# Altium schematic sheet AT-kdPDB.SchDoc
size A4; SheetNumber: 1; SheetTotal: 1
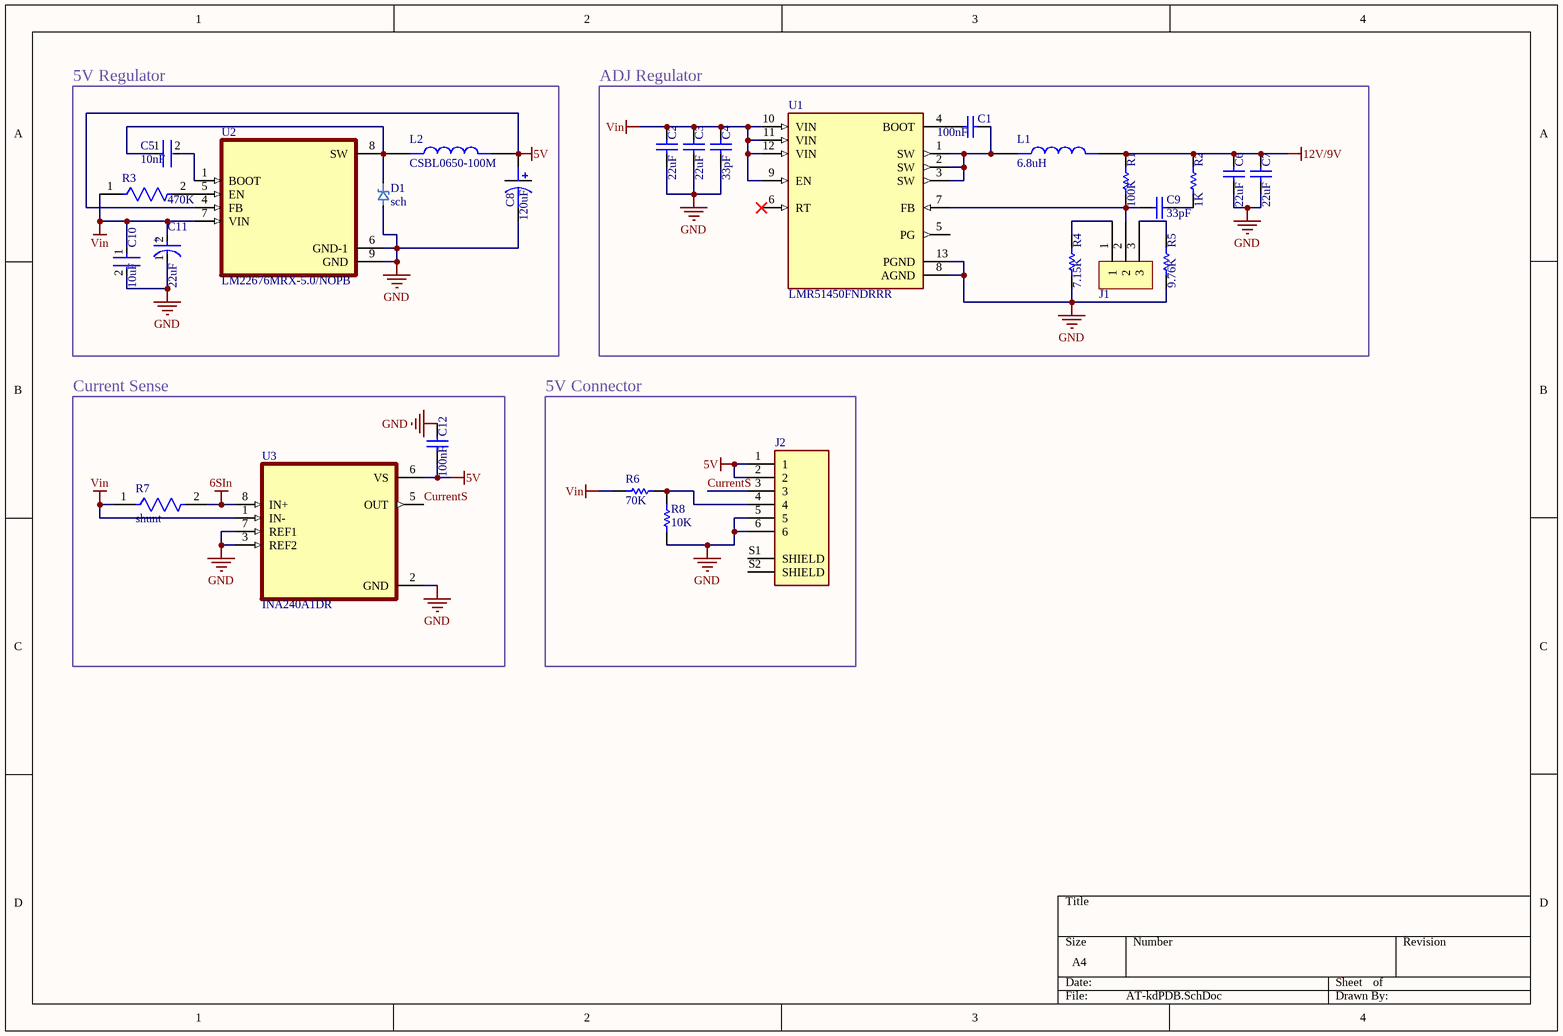
[diagram p0: AT-kdPDB.SchDoc]

## Parts
C1  100nF  [CAPC1206(3216)170_N]
C2  22uF  [CAPC1206(3216)190_L]
C3  22uF  [CAPC1206(3216)190_L]
C4  33pF  [CAPC1206(3216)190_L]
C5  10nF  [FP-C1206C-EB-MFG]
C6  22uF  [CAPC1206(3216)190_L]
C7  22uF  [CAPC1206(3216)190_L]
C8  120uF  [CAPAE660X600N]
C9  33pF  [CAPC1206(3216)170_N]
C10  10uF  [FP-GRM21B-0_2-e0_2_0_7-IPC_B]
C11  22uF  [FP-EEH-D-MFG]
C12  100nF  [CAPC1206(3216)170_N]
D1  sch  [RBR5LAM40ATFTR]
J1  jumperPad  [jumperPad]  (value not drawn)
J2  BM06B-GHS-TBT(LF)(SN)(N)  [JST_BM06B-GHS-TBT(LF)(SN)(N)]  (value not drawn)
L1  6.8uH  [IND_CSBX0650-6R8M]
L2  CSBL0650-100M  [IND_CSBL0650-100M]
R1  100K  [RESC3216X70X40ML20T20]
R2  1K  [RESC3216X70X40ML20T20]
R3  470K  [FP-CRCW1206-e3-IPC_A]
R4  7.15K  [RESC3216X70X40ML20T20]
R5  9.76K  [RESC3216X70X40ML20T20]
R6  70K  [RESC3216X70X40ML20T20]
R7  shunt  [FP-CSS2H-3920R-1L00F-MFG]
R8  10K  [RESC3216X70X40ML20T20]
U1  LMR51450FNDRRR  [CONV_LMR51450FNDRRR]
U2  LM22676MRX-5.0/NOPB  [VREG_LM5017MR/NOPB]
U3  INA240A1DR  [SOIC127P599X175-8N]

## Blocks framed on the sheet
5V Regulator: C5 C8 C10 C11 D1 L2 R3 U2
ADJ Regulator: C1-C4 C6 C7 C9 J1 L1 R1 R2 R4 R5 U1
Current Sense: C12 R7 U3
5V Connector: J2 R6 R8

## Nets
5V: C8.1(+) C12.2 J2.1 J2.2 L2.2 U2.4(FB) U3.6(VS)
6SIn: R7.2 U3.8(IN+)
12V/9V: C6.2 C7.2 L1.2 R1.2 R2.2
GND: C2.1 C3.1 C4.1 C6.1 C7.1 C8.2(-) C10.2 C11.1(C) C12.1 D1.1 J2.5 J2.6 R4.1 R5.1 R8.2 U1.8(AGND) U1.13(PGND) U2.6(GND-1) U2.9(GND) U3.2(GND) U3.3(REF2) U3.7(REF1)
Vin: C2.2 C3.2 C4.2 C10.1 C11.2(A) R3.1 R6.2 R7.1 U1.9(EN) U1.10(VIN) U1.11(VIN) U1.12(VIN) U2.7(VIN) U3.1(IN-)
CurrentS: J2.3 U3.5(OUT)
NetC1_1: C1.1 L1.1 U1.1(SW) U1.2(SW) U1.3(SW)
NetC1_2: C1.2 U1.4(BOOT)
NetC5_1: C5.1 D1.2 L2.1 U2.8(SW)
NetC5_2: C5.2 U2.1(BOOT)
NetC9_1: C9.1 J1.2 R1.1 U1.7(FB)
NetC9_2: C9.2 R2.1
NetJ1_1: J1.1 R4.2
NetJ1_3: J1.3 R5.2
NetJ2_4: J2.4 R6.1 R8.1
NetR3_2: R3.2 U2.5(EN)

Not connected (* = marked no-connect by the designer): J2 S1(SHIELD) S2(SHIELD); U1 5(PG) 6(RT)*

## Notes on the sheet
- (in symbol CMP-05428-001309-1) +

## Library data of the parts
C1 C9 C12 = CMP-1037-01161-1: CAP 33pF 500V ±2% 1206 (3216 Metric) Thickness 1.7mm SMD; Tolerance: Â±2%; Case-Metric: 3216; Case-EIA: 1206; Technology: SMT; Max Thickness: 1.7 mm; Rated Voltage: 500 V; Value: 33pF
C2-C4 C6 C7 = CMP-1037-04991-1: CAP 22uF 10V -20% to +80% 1206 (3216 Metric) Thickness 1.9mm SMD; Case-EIA: 1206; Case-Metric: 3216; Value: 22uF; Technology: SMT; Max Thickness: 1.9 mm; Rated Voltage: 10 V; Tolerance: -20% to +80%
C5 = CMP-03020-017471-2: C1206 10,000 pF X7R 5.00% 50 V; Manufacturer: KEMET; Manufacturer Part Number: C1206C103J5RAC7210; Material: Ceramic; Automotive Grade: Grade 0; Tolerance: 0.05; Voltage Rating: 50 V; Temperature Coefficient: 15%; Temperature Characteristic: X7R; Octopart: https://octopart.com/c1206c103j5rac7210-kemet-3788898; Lead Free: Yes; Automotive: Yes; Height: 0.88mm; Package: C1206C-EB; Temperature Range Low: -55°C; ComponentLink2Description: Datasheet; Ipc Land Pattern Name: CAPC320160X78; Temperature: -55°C to +150°C; Value: 10,000 pF; Capacitance: 10,000 pF; Temperature Range High: +150°C; Device Class L1: Passive Components; Device Class L3: Ceramic Capacitors; Category: Cap; Device Class L2: Capacitors; ComponentLink2URL: https://content.kemet.com/datasheets/KEM_C1007_X8R_ULTRA_150C_SMD.pdf; RoHS: TRUE
C8 = A768EB127M1DLAS034: A768, Aluminum, Polymer Aluminum, 120 uF, 20%, 20 VDC, -55/+125C, 125C, -55C, 125C, 2,000 Hrs, 34 mOhms, 480 uA, 6.3mm, 5.7mm, 1000; Manufacturer_Name: Yageo Group; Geometry.Height: 6mm; Mouser Part Number: *; Mouser Price/Stock: *; Manufacturer_Part_Number: A768EB127M1DLAS034; Datasheet Link: https://search.kemet.com/component-documentation/download/specsheet/A768EB127M1DLAS034
C10 = CMP-06035-021046-1: Chip Multilayer Ceramic Capacitors for General Purpose, 0805, 10uF, X6S, 22%, 10%, 35V; Case/Package: 0805; Case Code (Metric): 2012; Case Code (Imperial): 0805; Capacitance: 10uF; Voltage Rating (DC): 35V; Tolerance: 10%; Thickness: 0.057inch; Dielectric: X6S; Package Quantity: 3000; Weight: 0.000335oz; Termination: SMD/SMT; Max Operating Temperature: 105°C; Voltage Rating: 35V; Packaging: Tape and Reel; Width: 1.25mm; Mount: Surface Mount; Min Operating Temperature: -55°C; Length: 0.079inch; Height: 1.25mm; REACH SVHC: No SVHC; Lead Free: Lead Free
C11 = CMP-05428-001309-1: Aluminum Hybrid Polymer Capacitors 22uF 20% 50V Life 10000Hours AEC-Q200 RADIAL SMT; Ripple Current (AC): 1.1A; Lead Diameter: 0.65mm; Life (Hours): 5000Hour; ESR (Equivalent Series Resistance): 80mR; Leakage Current: 100uA; Technology: HYBRID; Height - Seated (Max): 0.24inch; Voltage Rating (DC): 50V; Min Operating Temperature: -55°C; Voltage Rating: 50V; Length: 5.8mm; Tolerance: 20%; Lead Pitch: 1.8mm; Voltage: 50V; Packaging: Tape and Reel; Mount: Surface Mount; REACH SVHC: No SVHC; Ripple Current: 1.1A; Case/Package: Radial; Package Quantity: 1000; Capacitance: 22uF; Series: ZA; Construction: Cylindrical; Diameter: 6.3mm; Height: 5.8mm; Max Operating Temperature: 105°C; Lead Free: Lead Free; RoHS Compliant: Yes; Termination: SMD/SMT; Material: Polymer; Radiation Hardening: No; Ratings: AEC-Q200
D1 = RBR5LAM40ATFTR
J2 = BM06B-GHS-TBT(LF)(SN)(N): Connector Header Surface Mount 6 position 0.049 (1.25mm); MF: JST Sales; SnapEDA_Link: https://www.snapeda.com/parts/BM06B-GHS-TBT(LF)(SN)(N)/JST/view-part/?ref=snap; Package: None; Value: *; MP: BM06B-GHS-TBT(LF)(SN)(N); Check_prices: https://www.snapeda.com/parts/BM06B-GHS-TBT(LF)(SN)(N)/JST/view-part/?ref=eda
L1 = CSBX0650-6R8M: Package: None; Price: None; Value: *; MP: CSBX0650-6R8M; Availability: Unavailable
R1 R2 R4-R6 R8 = CMP-2003-04519-1: Part Number: RK73B2BTTD104J; Manufacturer: KOA Speer
R3 = CMP-02407-010661-1: RES Thick Film, 470kΩ, 5%, 0.25W, 200ppm/°C, 1206; Max Power Dissipation: 250mW; Resistance: 470kR; Lead Free: Lead Free; Temperature Coefficient: 200ppm/°C; Length: 0.126inch; Height: 0.024inch; Number of Terminations: 2; Min Operating Temperature: -55°C; Width: 0.063inch; Max Operating Temperature: 155°C; Tolerance: 5%; Composition: Thick Film; Case/Package: 1206; Package Quantity: 20000; Features: Automotive AEC-Q200; Packaging: Tape and Reel
R7 = CMP-07231-006016-1: RES 0.001 OHM 1% 8W 3920; Temperature Coefficient: 50ppm/°C; Resistance: 1mR; Length: 0.394inch; Height: 0.02inch; RoHS Compliant: Yes; Packaging: Cut Tape; Case/Package: 3920; Width: 0.205inch; Features: Moisture Resistant; Case Code (Imperial): 3920; Case Code (Metric): 1052; Min Operating Temperature: -55°C; Tolerance: 1%; Power Rating: 8W; Resistor Type: Metal Element; Max Power Dissipation: 8W; REACH SVHC: No SVHC; Max Operating Temperature: 170°C; Number of Terminations: 2
U2 = LM22676MRX-5.0/NOPB: SIMPLE SWITCHERÂ® 4.5V to 42V, 3A Step-Down Regulator with Precision Enable; MF: Texas Instruments; SnapEDA_Link: https://www.snapeda.com/parts/LM22676MRX-5.0/NOPB/Texas+Instruments/view-part/?ref=snap; Package: HSOIC-8 Texas Instruments; Value: *; MP: LM22676MRX-5.0/NOPB; Check_prices: https://www.snapeda.com/parts/LM22676MRX-5.0/NOPB/Texas+Instruments/view-part/?ref=eda
U3 = INA240A1DR: -4 to 80V, bidirectional, ultra-precise current sense amplifier with enhanced PWM rejection; MF: Texas Instruments; SnapEDA_Link: https://www.snapeda.com/parts/INA240A1DR/Texas+Instruments/view-part/?ref=snap; Package: SOIC-8 Texas Instruments; Value: *; MP: INA240A1DR; Check_prices: https://www.snapeda.com/parts/INA240A1DR/Texas+Instruments/view-part/?ref=eda
L2 = CSBL0650-100M: Package: None; Price: None; Value: *; MP: CSBL0650-100M; Availability: Unavailable
U1 = LMR51450FNDRRR: Package: None; Price: None; Value: *; MP: LMR51450FNDRRR; Availability: Unavailable